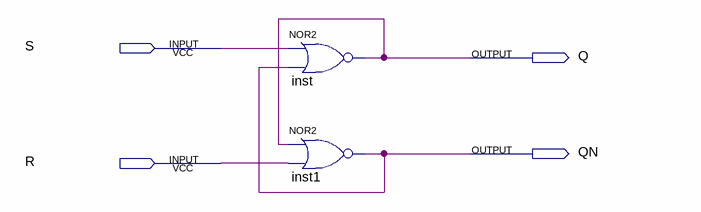
[diagram p0: schematic sheet]
// Quartus schematic lab9step1a.bdf as structural Verilog: 2 symbols, 4 pins
module lab9step1a (
  input  S,
  input  R,
  output Q,
  output QN
);

  nor inst (Q, S, QN);
  nor inst1 (QN, Q, R);
endmodule
